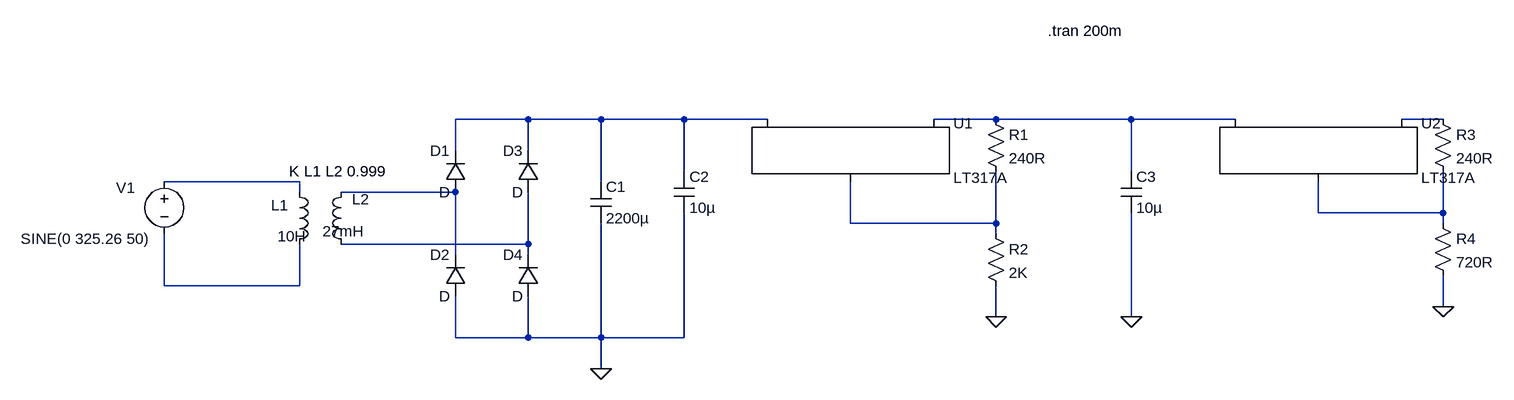
[diagram p0: schematic 220V to 12 à 5V.asc]
220V to 12 à 5V.asc, the LTspice schematic file:
Version 4.1
SHEET 1 1844 680
WIRE 352 -32 240 -32
WIRE 464 -32 352 -32
WIRE 592 -32 464 -32
WIRE 720 -32 592 -32
WIRE 1072 -32 976 -32
WIRE 1280 -32 1072 -32
WIRE 1440 -32 1280 -32
WIRE 1760 -32 1696 -32
WIRE 240 16 240 -32
WIRE 352 16 352 -32
WIRE 592 48 592 -32
WIRE 1280 48 1280 -32
WIRE 0 64 -208 64
WIRE 464 64 464 -32
WIRE 0 80 0 64
WIRE 240 80 64 80
WIRE 1568 112 1568 64
WIRE 1760 112 1760 48
WIRE 1760 112 1568 112
WIRE 848 128 848 64
WIRE 1072 128 1072 48
WIRE 1072 128 848 128
WIRE 1760 128 1760 112
WIRE 1072 144 1072 128
WIRE 352 160 352 80
WIRE 352 160 64 160
WIRE 240 176 240 80
WIRE 352 176 352 160
WIRE -208 224 -208 144
WIRE 0 224 0 160
WIRE 0 224 -208 224
WIRE 1760 256 1760 208
WIRE 1072 272 1072 224
WIRE 1280 272 1280 112
WIRE 240 304 240 240
WIRE 352 304 352 240
WIRE 352 304 240 304
WIRE 464 304 464 128
WIRE 464 304 352 304
WIRE 592 304 592 112
WIRE 592 304 464 304
WIRE 464 352 464 304
FLAG 464 352 0
FLAG 1072 272 0
FLAG 1760 256 0
FLAG 1280 272 0
SYMBOL voltage -208 48 R0
WINDOW 0 -74 25 Left 2
WINDOW 3 -221 104 Left 2
WINDOW 123 0 0 Left 0
WINDOW 39 0 0 Left 0
SYMATTR InstName V1
SYMATTR Value SINE(0 325.26 50)
SYMBOL ind -16 64 R0
WINDOW 0 -28 36 Left 2
WINDOW 3 -18 84 Left 2
SYMATTR InstName L1
SYMATTR Value 10H
SYMATTR Type ind
SYMATTR SpiceLine Rser=10
SYMBOL ind 80 176 R180
WINDOW 0 -28 85 Left 2
WINDOW 3 -20 36 Left 2
SYMATTR InstName L2
SYMATTR Value 27mH
SYMATTR Type ind
SYMBOL diode 256 80 R180
WINDOW 0 24 64 Left 2
WINDOW 3 24 0 Left 2
SYMATTR InstName D1
SYMBOL diode 256 240 R180
WINDOW 0 24 64 Left 2
WINDOW 3 24 0 Left 2
SYMATTR InstName D2
SYMBOL diode 368 80 R180
WINDOW 0 24 64 Left 2
WINDOW 3 24 0 Left 2
SYMATTR InstName D3
SYMBOL diode 368 240 R180
WINDOW 0 24 64 Left 2
WINDOW 3 24 0 Left 2
SYMATTR InstName D4
SYMBOL PowerProducts\\LT317A 848 -32 R0
SYMATTR InstName U1
SYMBOL cap 448 64 R0
SYMATTR Value 2200µ
SYMATTR InstName C1
SYMATTR SpiceLine V=25 Irms=1.23 Rser=0.053 Lser=0 mfg="Nichicon" pn="UPR1E222MRH" type="Al electrolytic"
SYMBOL cap 576 48 R0
SYMATTR InstName C2
SYMATTR Value 10µ
SYMATTR SpiceLine V=50 Irms=0 Rser=0.003 Lser=1.2n mfg="Würth Elektronik" pn="885012214005 WCAP-CSGP 2220" type="X7R"
SYMBOL res 1056 -48 R0
SYMATTR InstName R1
SYMATTR Value 240R
SYMBOL res 1056 128 R0
SYMATTR InstName R2
SYMATTR Value 2K
SYMBOL PowerProducts\\LT317A 1568 -32 R0
SYMATTR InstName U2
SYMBOL res 1744 -48 R0
SYMATTR InstName R3
SYMATTR Value 240R
SYMBOL res 1744 112 R0
SYMATTR InstName R4
SYMATTR Value 720R
SYMBOL cap 1264 48 R0
SYMATTR InstName C3
SYMATTR Value 10µ
SYMATTR SpiceLine V=50 Irms=0 Rser=0.003 Lser=1.2n mfg="Würth Elektronik" pn="885012214005 WCAP-CSGP 2220" type="X7R"
TEXT -16 48 Left 2 !K L1 L2 0.999
TEXT 1152 -168 Left 2 !.tran 200m

The netlist it stands for:
* 220V to 12 à 5V.asc
V1 N004 N009 SINE(0 325.26 50)
L1 N004 N009 10H Rser=10
L2 N008 N005 27mH
D1 N005 N001 D
D2 0 N005 D
D3 N008 N001 D
D4 0 N008 D
X§U1 N007 N002 N001 LT317A
C1 N001 0 2200µ V=25 Irms=1.23 Rser=0.053 Lser=0 mfg="Nichicon" pn="UPR1E222MRH" type="Al electrolytic"
C2 N001 0 10µ V=50 Irms=0 Rser=0.003 Lser=1.2n mfg="Würth Elektronik" pn="885012214005 WCAP-CSGP 2220" type="X7R"
R1 N002 N007 240R
R2 N007 0 2K
X§U2 N006 N003 N002 LT317A
R3 N003 N006 240R
R4 N006 0 720R
C3 N002 0 10µ V=50 Irms=0 Rser=0.003 Lser=1.2n mfg="Würth Elektronik" pn="885012214005 WCAP-CSGP 2220" type="X7R"
.model D D
.lib standard.dio
K L1 L2 0.999
.tran 200m
.lib LTC.lib
.backanno
.end